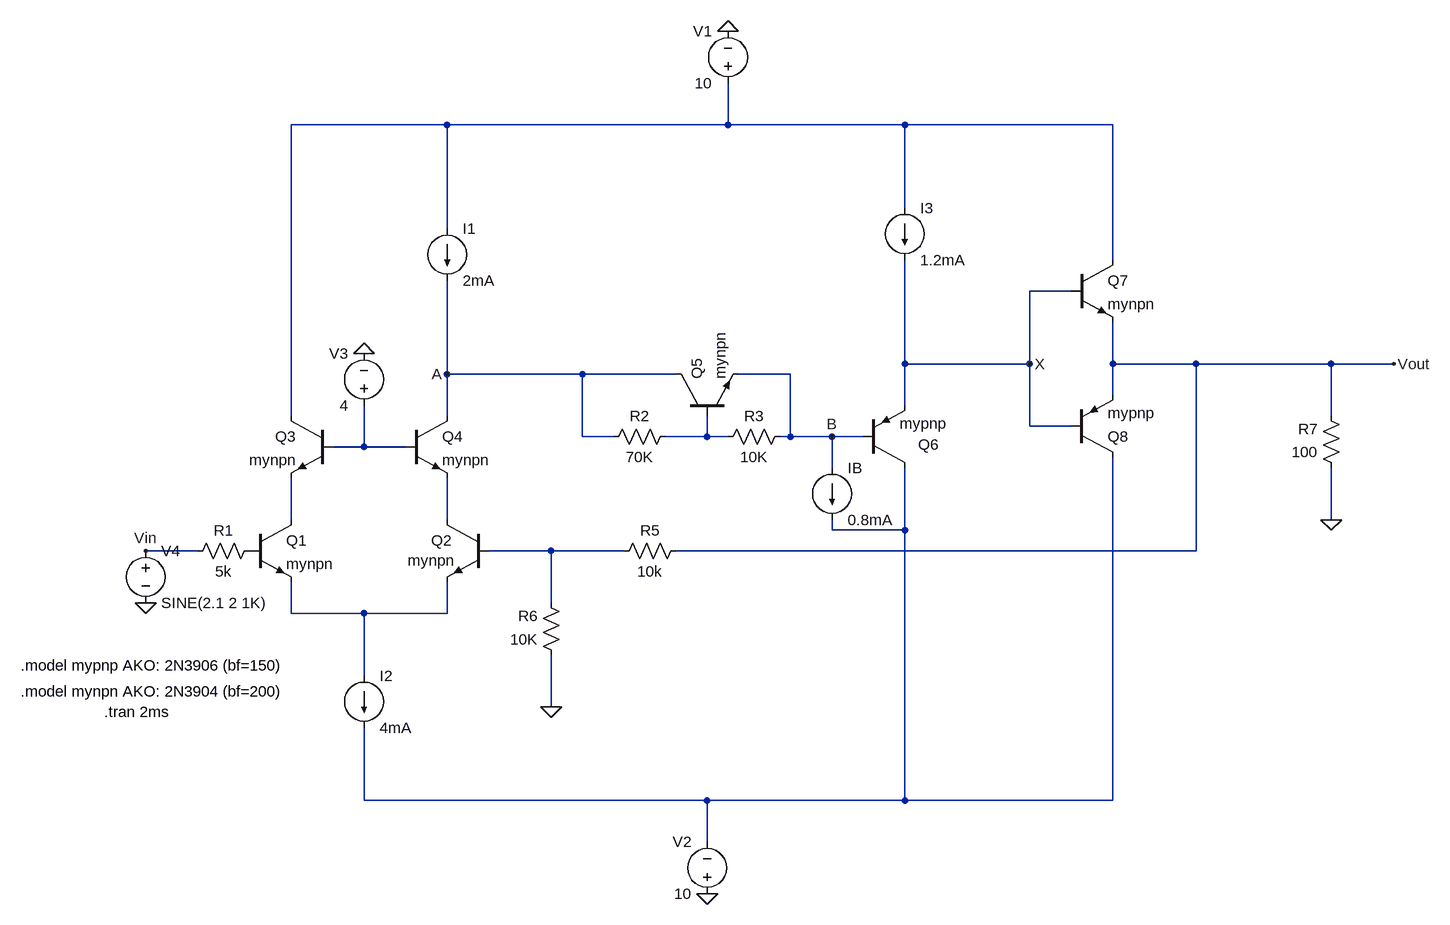
[diagram p0: schematic Q3_SECTION9.asc]
Q3_SECTION9.asc, the LTspice schematic file:
Version 4
SHEET 1 1752 696
WIRE 224 -528 -16 -528
WIRE 656 -528 656 -592
WIRE 656 -528 224 -528
WIRE 928 -528 656 -528
WIRE 1248 -528 928 -528
WIRE 928 -400 928 -528
WIRE 224 -368 224 -528
WIRE 1248 -320 1248 -528
WIRE 1184 -272 1120 -272
WIRE 928 -160 928 -320
WIRE 1120 -160 1120 -272
WIRE 1120 -160 928 -160
WIRE 1248 -160 1248 -224
WIRE 1376 -160 1248 -160
WIRE 1584 -160 1376 -160
WIRE 1680 -160 1584 -160
WIRE 224 -144 224 -288
WIRE 432 -144 224 -144
WIRE 576 -144 432 -144
WIRE 752 -144 672 -144
WIRE 1248 -112 1248 -160
WIRE 928 -96 928 -160
WIRE -16 -80 -16 -528
WIRE 224 -80 224 -144
WIRE 1584 -80 1584 -160
WIRE 1120 -64 1120 -160
WIRE 1184 -64 1120 -64
WIRE 432 -48 432 -144
WIRE 480 -48 432 -48
WIRE 624 -48 624 -80
WIRE 624 -48 560 -48
WIRE 656 -48 624 -48
WIRE 752 -48 752 -144
WIRE 752 -48 736 -48
WIRE 816 -48 752 -48
WIRE 864 -48 816 -48
WIRE 96 -32 96 -96
WIRE 96 -32 48 -32
WIRE 160 -32 96 -32
WIRE 816 0 816 -48
WIRE -16 80 -16 16
WIRE 224 80 224 16
WIRE 1584 80 1584 0
WIRE 816 96 816 80
WIRE 928 96 928 0
WIRE 928 96 816 96
WIRE -160 128 -240 128
WIRE 384 128 288 128
WIRE 496 128 384 128
WIRE 1376 128 1376 -160
WIRE 1376 128 576 128
WIRE 384 208 384 128
WIRE -16 224 -16 176
WIRE 96 224 -16 224
WIRE 224 224 224 176
WIRE 224 224 96 224
WIRE 96 320 96 224
WIRE 384 368 384 288
WIRE 96 512 96 400
WIRE 624 512 96 512
WIRE 928 512 928 96
WIRE 928 512 624 512
WIRE 1248 512 1248 -16
WIRE 1248 512 928 512
WIRE 624 576 624 512
FLAG 384 368 0
FLAG 1584 80 0
FLAG 656 -672 0
FLAG 624 656 0
FLAG 1680 -160 Vout
FLAG 224 -144 A
FLAG 816 -48 B
FLAG 1120 -160 X
FLAG 96 -176 0
FLAG -240 208 0
FLAG -240 128 Vin
SYMBOL npn -80 80 R0
SYMATTR InstName Q1
SYMATTR Value mynpn
SYMBOL npn 288 80 M0
WINDOW 3 52 63 Left 2
SYMATTR Value mynpn
SYMATTR InstName Q2
SYMBOL npn 48 -80 M0
SYMATTR InstName Q3
SYMATTR Value mynpn
SYMBOL npn 160 -80 R0
SYMATTR InstName Q4
SYMATTR Value mynpn
SYMBOL npn 576 -80 R270
SYMATTR InstName Q5
SYMATTR Value mynpn
SYMBOL pnp 864 0 M180
WINDOW 0 85 36 Left 2
SYMATTR InstName Q6
SYMATTR Value mypnp
SYMBOL npn 1184 -320 R0
SYMATTR InstName Q7
SYMATTR Value mynpn
SYMBOL pnp 1184 -16 M180
SYMATTR InstName Q8
SYMATTR Value mypnp
SYMBOL res -64 112 R90
WINDOW 0 0 56 VBottom 2
WINDOW 3 32 56 VTop 2
SYMATTR InstName R1
SYMATTR Value 5k
SYMBOL res 576 -64 R90
WINDOW 0 0 56 VBottom 2
WINDOW 3 32 56 VTop 2
SYMATTR InstName R2
SYMATTR Value 70K
SYMBOL res 752 -64 R90
WINDOW 0 0 56 VBottom 2
WINDOW 3 32 56 VTop 2
SYMATTR InstName R3
SYMATTR Value 10K
SYMBOL res 592 112 R90
WINDOW 0 0 56 VBottom 2
WINDOW 3 32 56 VTop 2
SYMATTR InstName R5
SYMATTR Value 10k
SYMBOL res 400 304 R180
WINDOW 0 36 76 Left 2
WINDOW 3 36 40 Left 2
SYMATTR InstName R6
SYMATTR Value 10K
SYMBOL res 1600 16 R180
WINDOW 0 36 76 Left 2
WINDOW 3 36 40 Left 2
SYMATTR InstName R7
SYMATTR Value 100
SYMBOL current 224 -368 R0
WINDOW 123 0 0 Left 0
WINDOW 39 0 0 Left 0
SYMATTR InstName I1
SYMATTR Value 2mA
SYMBOL current 96 320 R0
WINDOW 123 0 0 Left 0
WINDOW 39 0 0 Left 0
SYMATTR InstName I2
SYMATTR Value 4mA
SYMBOL current 928 -400 R0
WINDOW 123 0 0 Left 0
WINDOW 39 0 0 Left 0
SYMATTR InstName I3
SYMATTR Value 1.2mA
SYMBOL current 816 0 R0
WINDOW 123 0 0 Left 0
WINDOW 39 0 0 Left 0
SYMATTR InstName IB
SYMATTR Value 0.8mA
SYMBOL voltage 656 -576 R180
WINDOW 0 24 96 Left 2
WINDOW 3 24 16 Left 2
WINDOW 123 0 0 Left 0
WINDOW 39 0 0 Left 0
SYMATTR InstName V1
SYMATTR Value 10
SYMBOL voltage 624 672 R180
WINDOW 0 24 96 Left 2
WINDOW 3 24 16 Left 2
SYMATTR InstName V2
SYMATTR Value 10
SYMBOL voltage 96 -80 R180
WINDOW 0 24 96 Left 2
WINDOW 3 24 16 Left 2
WINDOW 123 0 0 Left 0
WINDOW 39 0 0 Left 0
SYMATTR InstName V3
SYMATTR Value 4
SYMBOL voltage -240 112 R0
WINDOW 123 0 0 Left 0
WINDOW 39 0 0 Left 0
SYMATTR InstName V4
SYMATTR Value SINE(2.1 2 1K)
TEXT -432 304 Left 2 !.model mypnp AKO: 2N3906 (bf=150)
TEXT -432 344 Left 2 !.model mynpn AKO: 2N3904 (bf=200)
TEXT -304 376 Left 2 !.tran 2ms

The netlist it stands for:
* Q3_SECTION9.asc
Q1 N004 P001 N008 0 mynpn
Q2 N005 N007 N008 0 mynpn
Q3 N001 N003 N004 0 mynpn
Q4 A N003 N005 0 mynpn
Q5 A N002 B 0 mynpn
Q6 N006 B X 0 mypnp
Q7 N001 X Vout 0 mynpn
Q8 N006 X Vout 0 mypnp
R1 P001 Vin 5k
R2 N002 A 70K
R3 B N002 10K
R5 Vout N007 10k
R6 0 N007 10K
R7 0 Vout 100
I1 N001 A 2mA
I2 N008 N006 4mA
I3 N001 X 1.2mA
IB B N006 0.8mA
V1 N001 0 10
V2 0 N006 10
V3 N003 0 4
V4 Vin 0 SINE(2.1 2 1K)
.model NPN NPN
.model PNP PNP
.lib standard.bjt
.model mypnp AKO: 2N3906 (bf=150)
.model mynpn AKO: 2N3904 (bf=200)
.tran 2ms
.backanno
.end